# Altium schematic sheet MCU.SchDoc
size B; SheetNumber: 3; SheetTotal: 5
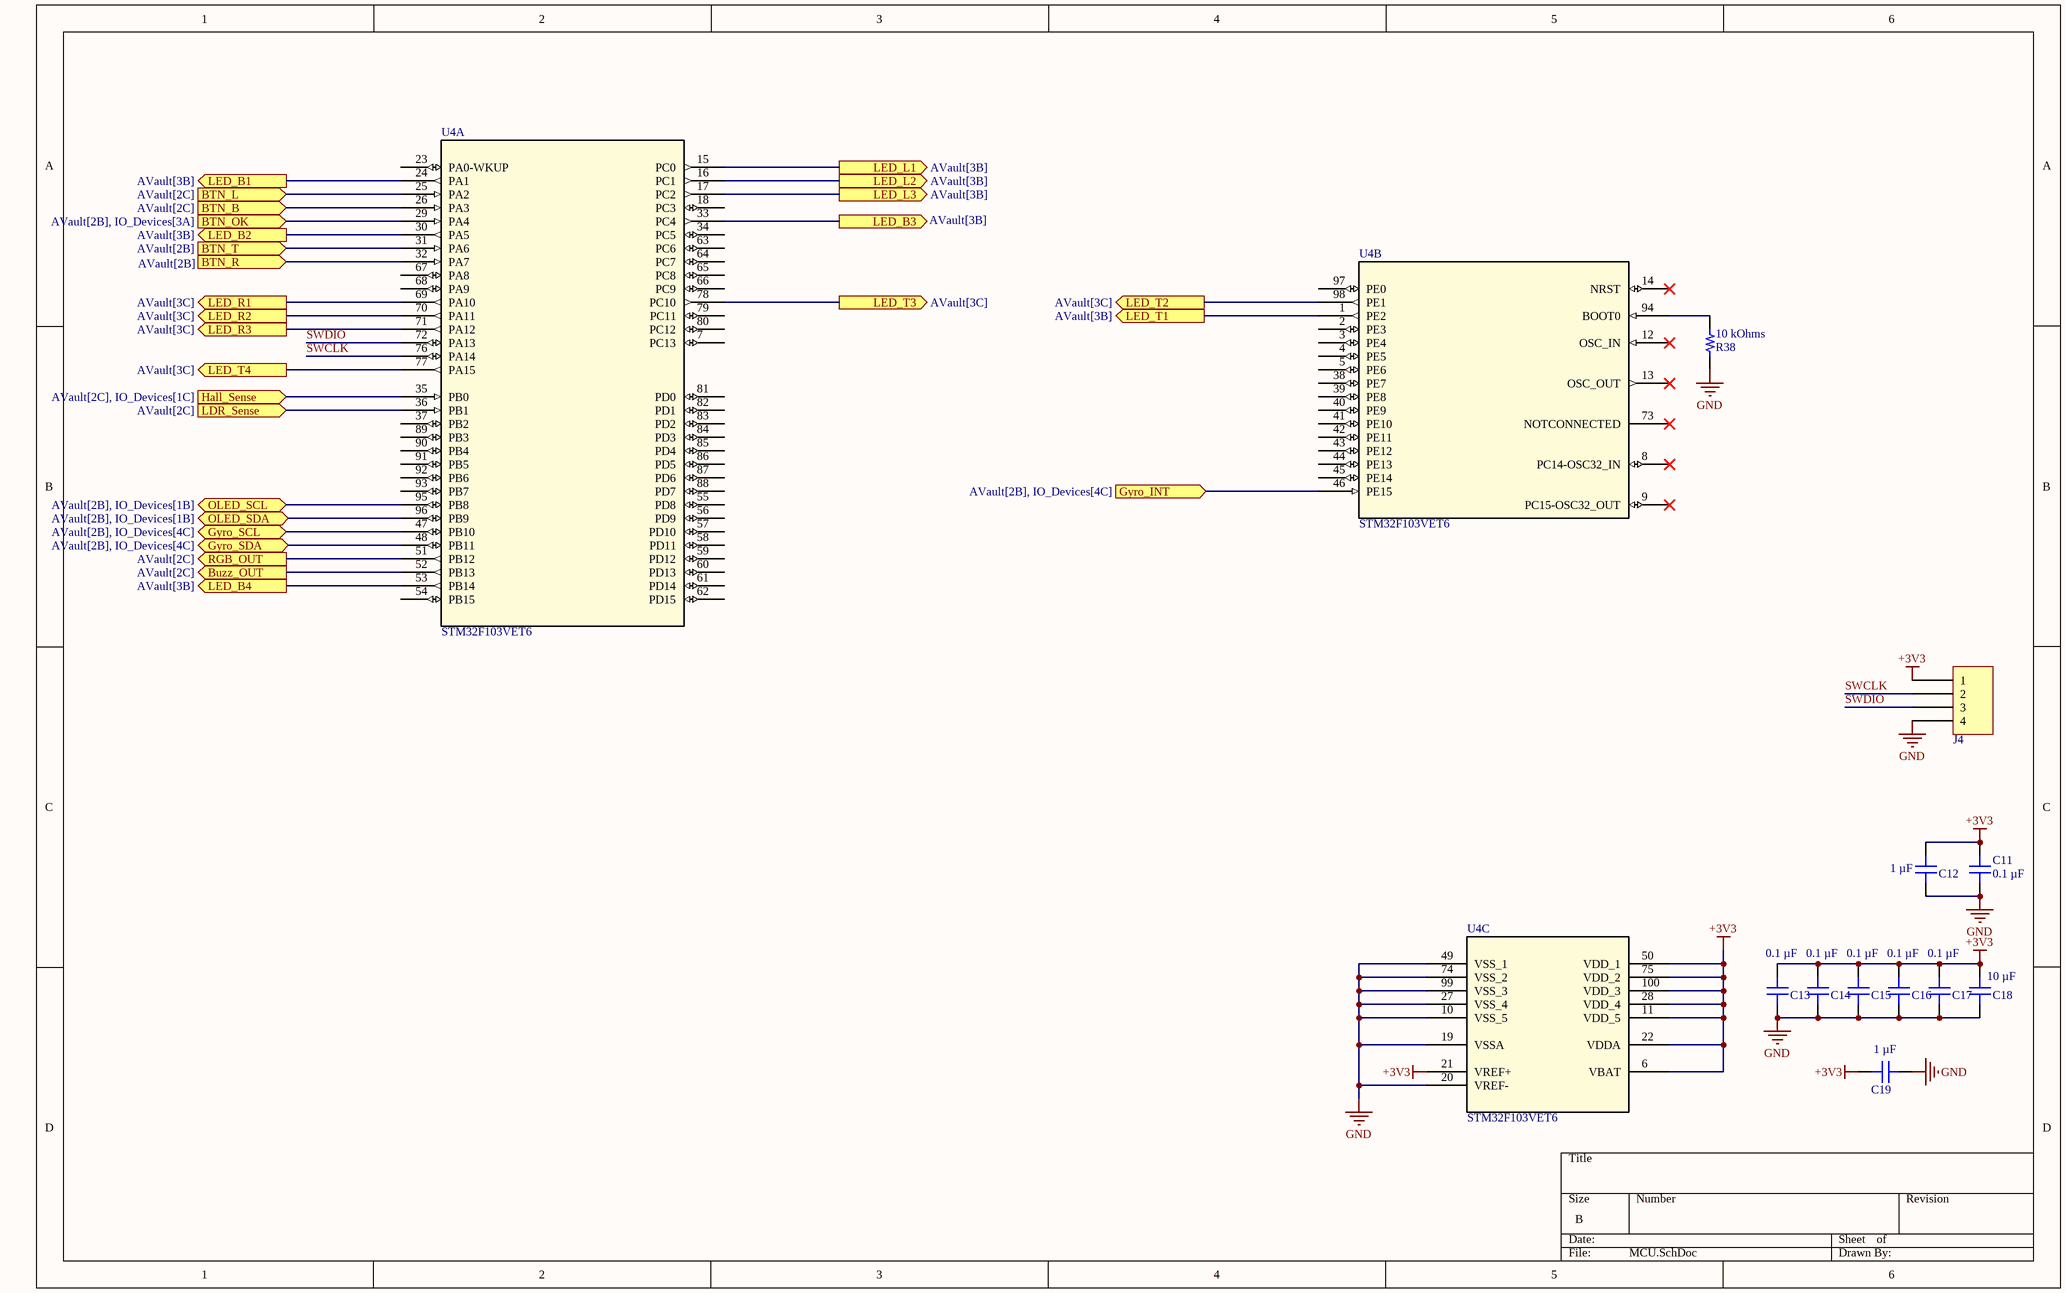
[diagram p0: MCU.SchDoc]

## Parts
C11  0.1 µF  [CAP 0603_1608]
C12  1 µF  [CAP 0603_1608]
C13  0.1 µF  [CAP 0603_1608]
C14  0.1 µF  [CAP 0603_1608]
C15  0.1 µF  [CAP 0603_1608]
C16  0.1 µF  [CAP 0603_1608]
C17  0.1 µF  [CAP 0603_1608]
C18  10 µF  [CAP 0805_2012]
C19  1 µF  [CAP 0603_1608]
J4  0022272041  [MOLEX KK 0022272041]  (value not drawn)
R38  10 kOhms  [RES 0805_2012]
U4  STM32F103VET6  [LQFP100-14x14mm]  (parts A,B,C of 3)

## Ports
BTN_B (in, see AVault[2C]), BTN_L (in, see AVault[2C]), BTN_OK (in, see AVault[2B], IO_Devices[3A]), BTN_R (in, see AVault[2B]), BTN_T (in, see AVault[2B]), Buzz_OUT (out, see AVault[2C]), Gyro_INT (in, see AVault[2B], IO_Devices[4C]), Gyro_SCL (bidir, see AVault[2B], IO_Devices[4C]), Gyro_SDA (bidir, see AVault[2B], IO_Devices[4C]), Hall_Sense (in, see AVault[2C], IO_Devices[1C]), LDR_Sense (in, see AVault[2C]), LED_B1 (out, see AVault[3B]), LED_B2 (out, see AVault[3B]), LED_B3 (out, see AVault[3B]), LED_B4 (out, see AVault[3B]), LED_L1 (out, see AVault[3B]), LED_L2 (out, see AVault[3B]), LED_L3 (out, see AVault[3B]), LED_R1 (out, see AVault[3C]), LED_R2 (out, see AVault[3C]), LED_R3 (out, see AVault[3C]), LED_T1 (out, see AVault[3B]), LED_T2 (out, see AVault[3C]), LED_T3 (out, see AVault[3C]), LED_T4 (out, see AVault[3C]), OLED_SCL (bidir, see AVault[2B], IO_Devices[1B]), OLED_SDA (bidir, see AVault[2B], IO_Devices[1B]), RGB_OUT (out, see AVault[2C])

## Nets
+3V3: C11.2 C12.2 C13.2 C14.2 C15.2 C16.2 C17.2 C18.2 C19.2 J4.1 U4.6(VBAT) U4.11(VDD_5) U4.21(VREF+) U4.22(VDDA) U4.28(VDD_4) U4.50(VDD_1) U4.75(VDD_2) U4.100(VDD_3)
GND: C11.1 C12.1 C13.1 C14.1 C15.1 C16.1 C17.1 C18.1 C19.1 J4.4 R38.1 U4.10(VSS_5) U4.19(VSSA) U4.20(VREF-) U4.27(VSS_4) U4.49(VSS_1) U4.74(VSS_2) U4.99(VSS_3)
BTN_B: U4.26(PA3) ; port BTN_B
BTN_L: U4.25(PA2) ; port BTN_L
BTN_OK: U4.29(PA4) ; port BTN_OK
BTN_R: U4.32(PA7) ; port BTN_R
BTN_T: U4.31(PA6) ; port BTN_T
Buzz_OUT: U4.52(PB13) ; port Buzz_OUT
Gyro_INT: U4.46(PE15) ; port Gyro_INT
Gyro_SCL: U4.47(PB10) ; port Gyro_SCL
Gyro_SDA: U4.48(PB11) ; port Gyro_SDA
Hall_Sense: U4.35(PB0) ; port Hall_Sense
LDR_Sense: U4.36(PB1) ; port LDR_Sense
LED_B1: U4.24(PA1) ; port LED_B1
LED_B2: U4.30(PA5) ; port LED_B2
LED_B3: U4.33(PC4) ; port LED_B3
LED_B4: U4.53(PB14) ; port LED_B4
LED_L1: U4.15(PC0) ; port LED_L1
LED_L2: U4.16(PC1) ; port LED_L2
LED_L3: U4.17(PC2) ; port LED_L3
LED_R1: U4.69(PA10) ; port LED_R1
LED_R2: U4.70(PA11) ; port LED_R2
LED_R3: U4.71(PA12) ; port LED_R3
LED_T1: U4.1(PE2) ; port LED_T1
LED_T2: U4.98(PE1) ; port LED_T2
LED_T3: U4.78(PC10) ; port LED_T3
LED_T4: U4.77(PA15) ; port LED_T4
OLED_SCL: U4.95(PB8) ; port OLED_SCL
OLED_SDA: U4.96(PB9) ; port OLED_SDA
RGB_OUT: U4.51(PB12) ; port RGB_OUT
SWCLK: J4.2 U4.76(PA14)
SWDIO: J4.3 U4.72(PA13)
NetR38_2: R38.2 U4.94(BOOT0)

Not connected (* = marked no-connect by the designer): U4 2(PE3) 3(PE4) 4(PE5) 5(PE6) 7(PC13) 8(PC14-OSC32_IN)* 9(PC15-OSC32_OUT)* 12(OSC_IN)* 13(OSC_OUT)* 14(NRST)* 18(PC3) 23(PA0-WKUP) 34(PC5) 37(PB2) 38(PE7) 39(PE8) 40(PE9) 41(PE10) 42(PE11) 43(PE12) 44(PE13) 45(PE14) 54(PB15) 55(PD8) 56(PD9) 57(PD10) 58(PD11) 59(PD12) 60(PD13) 61(PD14) 62(PD15) 63(PC6) 64(PC7) 65(PC8) 66(PC9) 67(PA8) 68(PA9) 73(NOTCONNECTED)* 79(PC11) 80(PC12) 81(PD0) 82(PD1) 83(PD2) 84(PD3) 85(PD4) 86(PD5) 87(PD6) 88(PD7) 89(PB3) 90(PB4) 91(PB5) 92(PB6) 93(PB7) 97(PE0)

## Library data of the parts
C11 C13-C17 = GRM188R72A104KA35D: CAP CER 0.1UF 100V X7R 0603; Manufacturer: Murata Electronics; id: 1738; Tolerance: ±10%; Part Number: GRM188R72A104KA35D; Value: 0.1 µF; Temperature Coefficient: X7R; Supplier Part Number 1: 490-3285-1-ND; ComponentLink2Description: DigiKey Link; ComponentLink1URL: https:\\www.murata.com\~\media\webrenewal\support\library\catalog\products\capacitor\mlcc\c02e.ashx?la=en-us; PartId: 9563; Supplier 1: DigiKey; Series: GRM; LastUpdated: 2023-01-03T20:07:27.117; Part Status: Active; Capacitance: 0.1 µF; Device Package: 0603 (1608 Metric); Thickness (Max): 0.035" (0.90mm); Voltage - Rated: 100V; Minimum Order: 1; Packaging: TapeAndReel; Applications: General Purpose; Package / Case: 0603 (1608 Metric); ComponentLink1Description: Datasheet; Price: 0.02; ComponentLink2URL: https:\\www.digikey.com\en\products\detail\murata-electronics\GRM188R72A104KA35D\702549; Lifecycle Status: Active; Operating Temperature: -55°C ~ 125°C; Size / Dimension: 0.063" L x 0.031" W (1.60mm x 0.80mm); Mounting Type: Surface Mount, MLCC
C12 C19 = C1608X5R1E105K080AC: CAP CER 1UF 25V X5R 0603; Manufacturer: TDK Corporation; id: 6225; Tolerance: ±10%; Part Number: C1608X5R1E105K080AC; Value: 1 µF; Temperature Coefficient: X5R; Supplier Part Number 1: 445-5146-1-ND; ComponentLink2Description: DigiKey Link; Features: Low ESL; ComponentLink1URL: https:\\product.tdk.com\info\en\catalog\datasheets\mlcc_commercial_general_en.pdf?ref_disty=digikey; PartId: 36204; Supplier 1: DigiKey; Series: C; LastUpdated: 2023-01-03T20:06:52.917; Part Status: Active; Capacitance: 1 µF; Device Package: 0603 (1608 Metric); Thickness (Max): 0.035" (0.90mm); Voltage - Rated: 25V; Minimum Order: 1; Packaging: TapeAndReel; Applications: General Purpose; Package / Case: 0603 (1608 Metric); ComponentLink1Description: Datasheet; Price: 0.01; ComponentLink2URL: https:\\www.digikey.com\en\products\detail\tdk-corporation\C1608X5R1E105K080AC\2093414; Lifecycle Status: Active; Operating Temperature: -55°C ~ 85°C; Size / Dimension: 0.063" L x 0.031" W (1.60mm x 0.80mm); Mounting Type: Surface Mount, MLCC
C18 = C2012X5R1V106K125AC: CAP CER 10UF 35V X5R 0805; Manufacturer: TDK Corporation; id: 6404; Tolerance: ±10%; Value: 10 µF; Temperature Coefficient: X5R; Part Number: C2012X5R1V106K125AC; Supplier Part Number 1: 445-14418-1-ND; ComponentLink2Description: DigiKey Link; Features: Low ESL; ComponentLink1URL: https:\\product.tdk.com\info\en\catalog\datasheets\mlcc_commercial_general_en.pdf?ref_disty=digikey; PartId: 40531; Supplier 1: DigiKey; Series: C; LastUpdated: 2023-01-03T20:10:34.680; Part Status: Active; Capacitance: 10 µF; Device Package: 0805 (2012 Metric); Thickness (Max): 0.057" (1.45mm); Voltage - Rated: 35V; Minimum Order: 1; Packaging: TapeAndReel; Applications: General Purpose; Package / Case: 0805 (2012 Metric); ComponentLink1Description: Datasheet; Price: 0.14; ComponentLink2URL: https:\\www.digikey.com\en\products\detail\tdk-corporation\C2012X5R1V106K125AC\3951654; Lifecycle Status: Active; Operating Temperature: -55°C ~ 85°C; Size / Dimension: 0.079" L x 0.049" W (2.00mm x 1.25mm); Mounting Type: Surface Mount, MLCC
J4 = 0022272041: CONN HEADER VERT 4POS 2.54MM; Manufacturer: Molex; id: 78; Style: Board to Cable\Wire; Contact Length - Mating: 0.295" (7.49mm); Pitch - Mating: 0.100" (2.54mm); Number Of Positions: 4; Number Of Positions Loaded: All; Shrouding: Shrouded - 1 Wall; Material Flammability Rating: UL94 V-0; Overall Contact Length: 0.560" (14.22mm); Contact Length - Post: 0.140" (3.56mm); Part Number: 0022272041; Supplier Part Number 1: WM4113-ND; Contact Shape: Square; Termination: Solder; ComponentLink1Description: Datasheet; Connector Type: Header; Contact Material: Brass; ComponentLink2URL: http:\\digikey.com\product-detail\en\molex\0022272041\WM4113-ND\1130579; Contact Finish - Mating: Tin; ComponentLink1URL: https:\\www.molex.com\pdm_docs\sd\022272041_sd.pdf; Fastening Type: Friction Lock; Supplier 1: DigiKey; Number Of Rows: 1; Series: KK 6410; Part Status: Active; ComponentLink2Description: DigiKey Link; Contact Type: Male Pin; Packaging: Bulk; Insulation Height: 0.461" (11.70mm); Contact Finish - Post: Tin; Contact Finish Thickness - Mating: 100.0µin (2.54µm); Minimum Order: 1; PartId: 78; Lifecycle Status: Active; LastUpdated: 2020-01-12T23:52:05.287; Insulation Color: Natural; Mounting Type: Through Hole; Insulation Material: Polyamide (PA), Nylon; Price: 0.40
R38 = RNCP0805FTD10K0: RES 10K OHM 1% 1\4W 0805; Manufacturer: Stackpole Electronics Inc; id: 164; Temperature Coefficient: ±100ppm\°C; Power (Watts): 0.25W, 1\4W; Part Number: RNCP0805FTD10K0; Height - Seated (Max): 0.025" (0.65mm); Supplier Part Number 1: RNCP0805FTD10K0CT-ND; Supplier Device Package: 0805; ComponentLink1Description: Datasheet; ComponentLink2URL: https:\\www.digikey.com\en\products\detail\stackpole-electronics-inc\RNCP0805FTD10K0\2240262; Features: Anti-Sulfur; ComponentLink1URL: https:\\www.seielect.com\catalog\sei-rncp.pdf; Composition: Thin Film; Tolerance: ±1%; Supplier 1: DigiKey; Series: RNCP; Part Status: Active; ComponentLink2Description: DigiKey Link; Device Package: 0805 (2012 Metric); Packaging: TapeAndReel; Minimum Order: 1; Package / Case: 0805 (2012 Metric); PartId: 28021; Lifecycle Status: Active; LastUpdated: 2023-01-02T20:44:50.960; Operating Temperature: -55°C ~ 155°C; Number Of Terminations: 2; Value: 10 kOhms; Size / Dimension: 0.079" L x 0.049" W (2.00mm x 1.25mm); Price: 0.01; Resistance: 10 kOhms
U4 = STM32F103VET6: Mainstream Performance line, Arm Cortex-M3 MCU with 512 Kbytes of Flash memory, 72 MHz CPU, motor control, USB and CAN; Manufacturer Name: STMicroelectronics; Manufacturer Part Number: STM32F103VET6